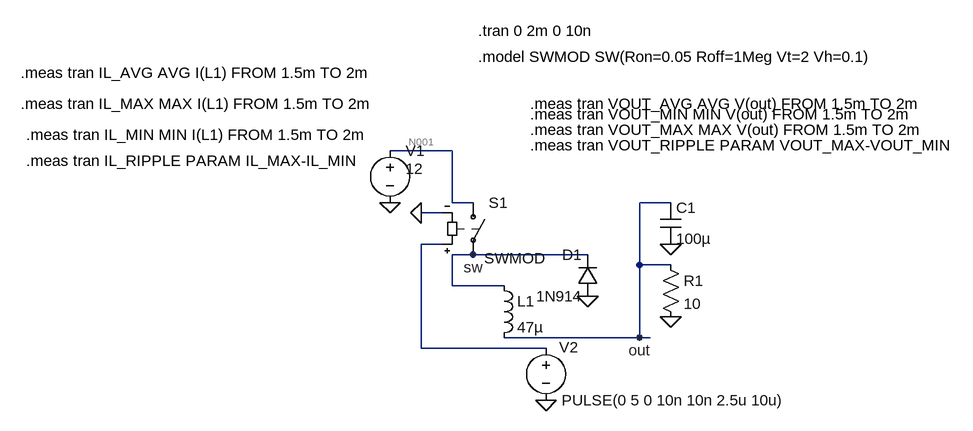
[diagram p0: schematic Draft4.asc]
Draft4.asc, the LTspice schematic file:
Version 4.1
SHEET 1 880 680
WIRE -32 144 -128 144
WIRE -32 224 -32 144
WIRE 0 224 -32 224
WIRE 304 224 256 224
WIRE -48 240 -80 240
WIRE -48 288 -80 288
WIRE 0 304 -32 304
WIRE 176 304 0 304
WIRE 256 320 256 224
WIRE 304 320 256 320
WIRE -32 352 -32 304
WIRE 48 352 -32 352
WIRE 256 432 256 320
WIRE 256 432 48 432
WIRE 272 432 256 432
WIRE -80 448 -80 288
WIRE 112 448 -80 448
FLAG -128 224 0
FLAG 112 528 0
FLAG 304 400 0
FLAG 176 368 0
FLAG -80 240 0
FLAG 304 288 0
FLAG 256 432 out
FLAG 0 304 sw
SYMBOL voltage -128 128 R0
WINDOW 3 24 44 Left 2
WINDOW 123 0 0 Left 0
WINDOW 39 0 0 Left 0
SYMATTR Value 12
SYMATTR InstName V1
SYMBOL voltage 112 432 R0
WINDOW 0 20 15 Left 2
WINDOW 123 0 0 Left 0
WINDOW 39 0 0 Left 0
SYMATTR InstName V2
SYMATTR Value PULSE(0 5 0 10n 10n 2.5u 10u)
SYMBOL sw 0 208 R0
WINDOW 3 17 102 Left 2
SYMATTR Value SWMOD
SYMATTR InstName S1
SYMBOL ind 32 336 R0
SYMATTR InstName L1
SYMATTR Value 47µ
SYMATTR SpiceLine Rser=1m
SYMBOL diode 192 368 R180
WINDOW 0 24 64 Left 2
WINDOW 3 24 0 Left 2
SYMATTR InstName D1
SYMATTR Value 1N914
SYMBOL cap 288 224 R0
SYMATTR InstName C1
SYMATTR Value 100µ
SYMBOL res 288 304 R0
SYMATTR InstName R1
SYMATTR Value 10
TEXT 8 0 Left 2 !.model SWMOD SW(Ron=0.05 Roff=1Meg Vt=2 Vh=0.1)
TEXT 8 -40 Left 2 !.tran 0 2m 0 10n
TEXT 88 72 Left 2 !.meas tran VOUT_AVG AVG V(out) FROM 1.5m TO 2m
TEXT 88 88 Left 2 !.meas tran VOUT_MIN MIN V(out) FROM 1.5m TO 2m
TEXT 88 112 Left 2 !.meas tran VOUT_MAX MAX V(out) FROM 1.5m TO 2m
TEXT 88 136 Left 2 !.meas tran VOUT_RIPPLE PARAM VOUT_MAX-VOUT_MIN
TEXT -696 24 Left 2 !.meas tran IL_AVG AVG I(L1) FROM 1.5m TO 2m
TEXT -696 72 Left 2 !.meas tran IL_MAX MAX I(L1) FROM 1.5m TO 2m
TEXT -688 120 Left 2 !.meas tran IL_MIN MIN I(L1) FROM 1.5m TO 2m
TEXT -688 160 Left 2 !.meas tran IL_RIPPLE PARAM IL_MAX-IL_MIN

The netlist it stands for:
* Draft4.asc
V1 N001 0 12
V2 N002 0 PULSE(0 5 0 10n 10n 2.5u 10u)
S1 N001 sw N002 0 SWMOD
L1 sw out 47µ Rser=1m
D1 0 sw 1N914
C1 out 0 100µ
R1 out 0 10
.model D D
.lib standard.dio
.model SWMOD SW(Ron=0.05 Roff=1Meg Vt=2 Vh=0.1)
.tran 0 2m 0 10n
.meas tran VOUT_AVG AVG V(out) FROM 1.5m TO 2m
.meas tran VOUT_MIN MIN V(out) FROM 1.5m TO 2m
.meas tran VOUT_MAX MAX V(out) FROM 1.5m TO 2m
.meas tran VOUT_RIPPLE PARAM VOUT_MAX-VOUT_MIN
.meas tran IL_AVG AVG I(L1) FROM 1.5m TO 2m
.meas tran IL_MAX MAX I(L1) FROM 1.5m TO 2m
.meas tran IL_MIN MIN I(L1) FROM 1.5m TO 2m
.meas tran IL_RIPPLE PARAM IL_MAX-IL_MIN
.backanno
.end

* Results of the author's LTspice run, read from the files saved beside the schematic
* Operating Point, zero values left out:
*   V(n001) = 12 V
*   V(out) = 120 µV
*   V(sw) = 120 µV
*   I(D1) = -6.665 pA
*   I(L1) = 12 µA
*   I(R1) = 12 µA
*   I(S1) = -12 µA
*   I(V1) = -12 µA
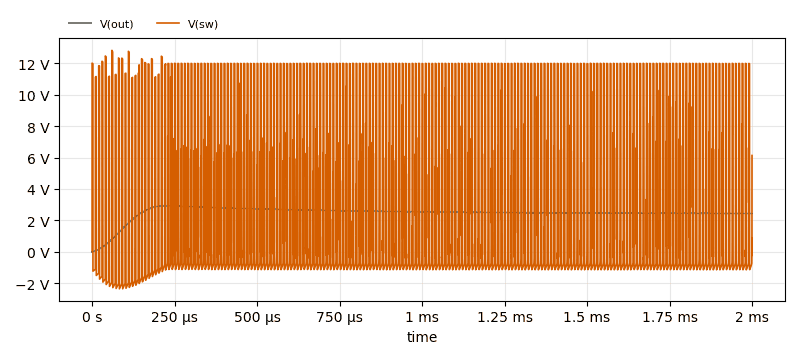
[diagram p1: Transient Analysis of Draft4.asc, plotted from the saved traces]
* Transient Analysis, 1 run:
*   V(out): min 120 µV, max 2.93 V, average 2.469 V, rms 2.511 V, last 2.435 V
*   V(sw): min -2.372 V, max 12.89 V, average 2.469 V, rms 6.156 V, last 4.433 V
* From the log:
*   vout_avg: AVG(V(out))=2.44906656352 FROM 0.0015 TO 0.002
*   vout_min: MIN(V(out))=2.43378543854 FROM 0.0015 TO 0.002
*   vout_max: MAX(V(out))=2.46729516983 FROM 0.0015 TO 0.002
*   vout_ripple: VOUT_MAX-VOUT_MIN=0.0335097312927
*   il_avg: AVG(I(L1))=0.239394773033 FROM 0.0015 TO 0.002
*   il_max: MAX(I(L1))=0.511346638203 FROM 0.0015 TO 0.002
*   il_min: MIN(I(L1))=-0.00151156552602 FROM 0.0015 TO 0.002
*   il_ripple: IL_MAX-IL_MIN=0.512858203729